# Altium schematic sheet Demo.SchDoc
size A4
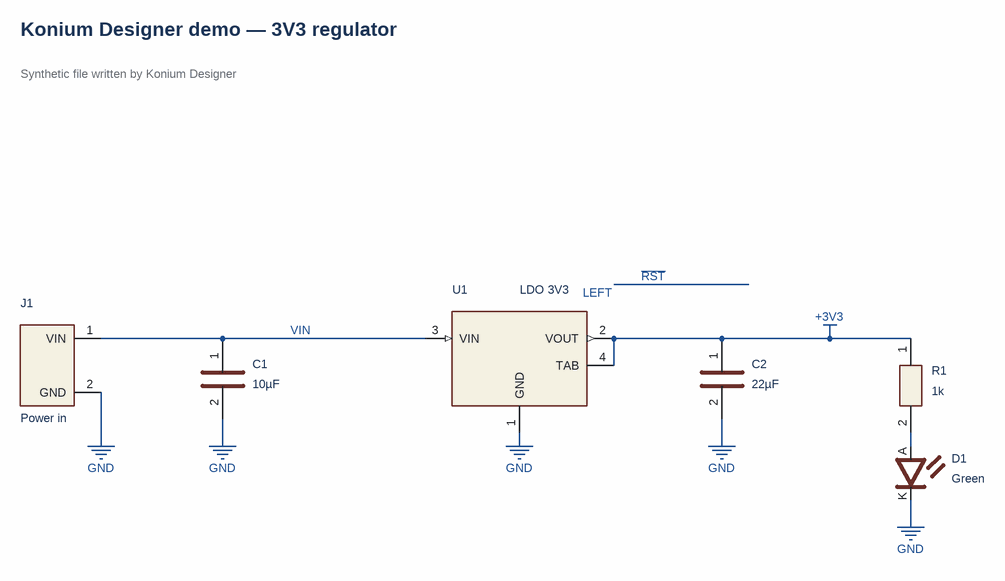
[diagram p0: Demo.SchDoc]

## Parts
C1  10µF  [0805]
C2  22µF  [0805]
D1  Green  [LED0805]
J1  Power in  [HDR1X2]
R1  1k  [0805]
U1  LDO 3V3  [SOT-223]

## Nets
+3V3: C2.1 R1.1 U1.2(VOUT) U1.4(TAB)
GND: C1.2 C2.2 D1.K J1.2(GND) U1.1(GND)
VIN: C1.1 J1.1(VIN) U1.3(VIN)
NetD1_A: D1.A R1.2

## Notes on the sheet
- Konium Designer demo — 3V3 regulator
- Synthetic file written by Konium Designer

## Library data of the parts
C1 C2 = Cap
D1 = LED
J1 = Header 2
R1 = Res
U1 = LDO SOT-223